# Altium project InterVehicle Communication.PrjPcb
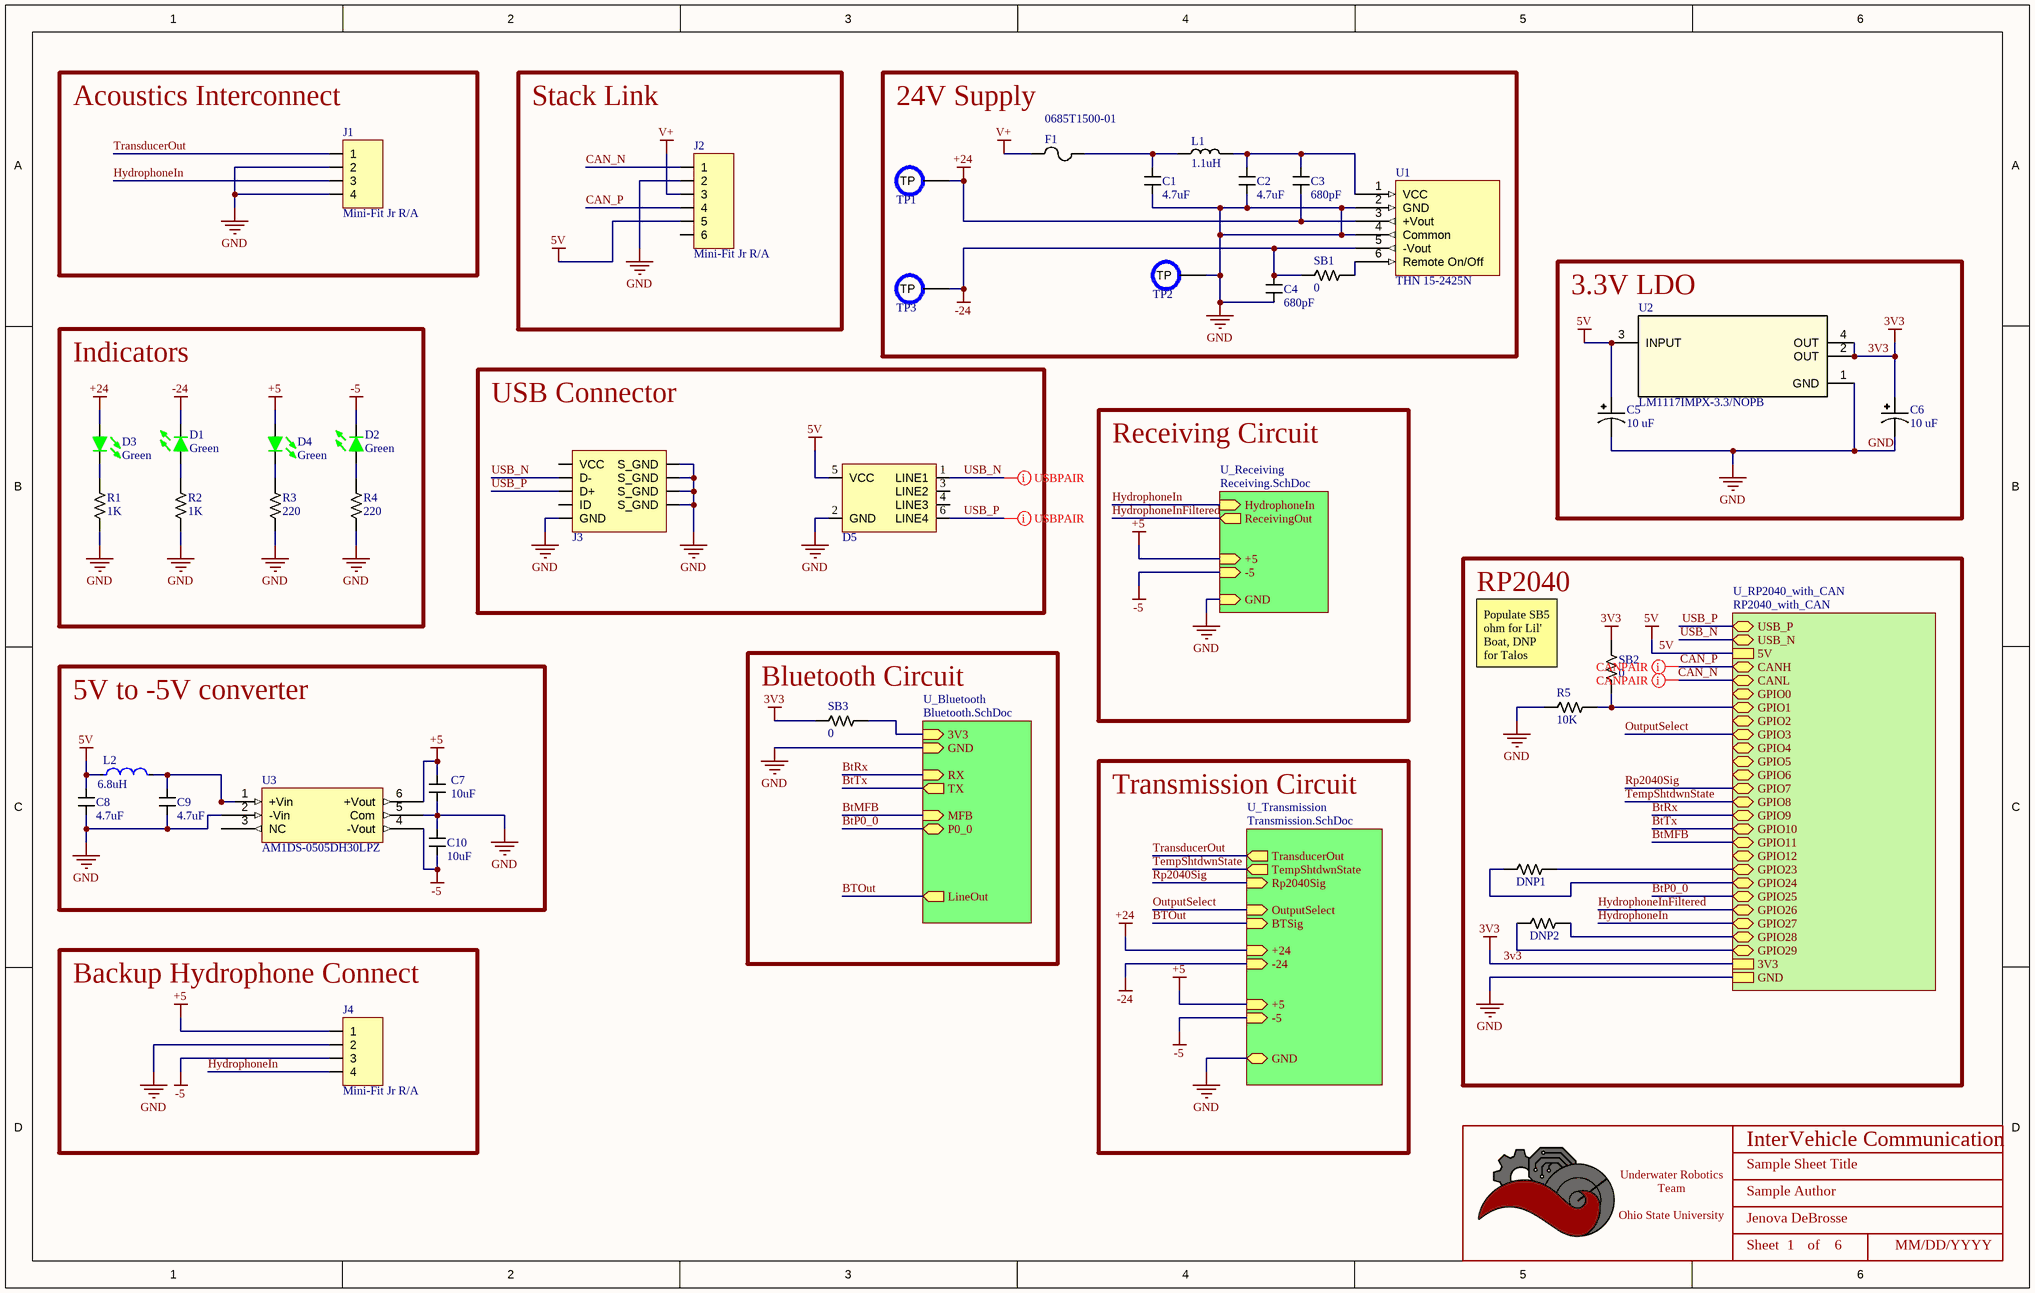
[diagram p0: Power and Connections.SchDoc]
BoardRevision: 1.0; DateOfDesignReview: XX/XX/XXXX; ProjectTitle: InterVehicle Communication; TeamLead: Jenova DeBrosse
4 sheets, 59 parts. Net scope: hierarchical (ports join the sheet entries above them; power ports are global).
Board files: Pcb_4layer_4x4_Template.PcbDoc, Pcb_2layer_4x4_Template.PcbDoc, Pcb_2layer_8x4_Template_NoCenterHoles.PcbDoc, Pcb_4layer_8x4_Template_NoCenterHoles.PcbDoc, Pcb_2layer_8x4_Template.PcbDoc, Pcb_4layer_8x4_Template.PcbDoc
Sheets:
  Power and Connections.SchDoc
    U_Receiving = Receiving.SchDoc
    U_Bluetooth = Bluetooth.SchDoc
    U_Transmission = Transmission.SchDoc

## Sheet Power and Connections.SchDoc: Sample Sheet Title
size B; Date: MM/DD/YYYY; Author: Sample Author; Organization: ORGANIZATION; Address1: ADDRESS 1; Address2: ADDRESS 2; Address3: ADDRESS 3; Address4: ADDRESS 4; Revision: -; SheetNumber: 1; SheetTotal: 6; ENG_APP_DATE: --/--/--; DSN_APP_DATE: --/--/--; CHK_APP_DATE: --/--/--

### Parts
(Parts that share a designator on the sheet are numbered #1, #2 ... from top to bottom, then left to right.)
*#1  Title_Block  [LOGO]  (value not drawn)  (graphical)
C1  value 4.7uF  [CAPACITOR_1206]  (hidden comment: AGC1206X7R500-475KXE*)
C2  value 4.7uF  [CAPACITOR_1206]  (hidden comment: AGC1206X7R500-475KXE*)
C3  value 680pF  [CAPACITOR_1808]  (hidden comment: CC1808KKX7REBB681)
C4  value 680pF  [CAPACITOR_1808]  (hidden comment: CC1808KKX7REBB681)
C5  Value (uF): 10 uF  [CAPACITOR_1206 - POLAR]  (hidden comment: 10uF Tantalum 16V)
C6  Value (uF): 10 uF  [CAPACITOR_1206 - POLAR]  (hidden comment: 10uF Tantalum 16V)
C7  value 10uF  [CAPACITOR_0603]  (hidden comment: CL10X106MO8NRNC)
C8  value 4.7uF  [CAPACITOR_0603]  (hidden comment: 4.7uF Ceramic 6.3V)
C9  value 4.7uF  [CAPACITOR_0603]  (hidden comment: 4.7uF Ceramic 6.3V)
C10  value 10uF  [CAPACITOR_0603]  (hidden comment: CL10X106MO8NRNC)
D1  Color: Green  [LED_0603]  (hidden comment: 150060GS75000)
D2  Color: Green  [LED_0603]  (hidden comment: 150060GS75000)
D3  Color: Green  [LED_0603]  (hidden comment: 150060GS75000)
D4  Color: Green  [LED_0603]  (hidden comment: 150060GS75000)
D5  TVS DIODE 5VWM 25VC SOT23-6  [SOT 23-6L]  (value not drawn)
DNP1  DNP  [RESISTOR_0402]  (value not drawn)
DNP2  DNP  [RESISTOR_0402]  (value not drawn)
F1  0685T1500-01  [CAPACITOR_1206]
J1  Mini-Fit Jr R/A  [CONN_MOLEX_MINIFIT JR_4 POS_R/A]
J2  Mini-Fit Jr R/A  [CONN_MOLEX_MINIFIT JR_6 POS_R/A]
J3  USB_MICRO R/A  [CONN_MINIUSB]  (value not drawn)
J4  Mini-Fit Jr R/A  [CONN_MOLEX_MINIFIT JR_4 POS_R/A]
L1  value 1.1uH  [INDUCTOR_TCK078]  (hidden comment: TCK-078)
L2  value 6.8uH  [INDUCTOR_0805]  (hidden comment: MLZ2012N6R8LT000)
R1  Value  (Ohms): 1K  [RESISTOR_0603]  (hidden comment: 1k Ohm 5% 1/8W)
R2  Value  (Ohms): 1K  [RESISTOR_0603]  (hidden comment: 1k Ohm 5% 1/8W)
R3  Value  (Ohms): 220  [RESISTOR_0603]  (hidden comment: 220 Ohm 5% 1/8W)
R4  Value  (Ohms): 220  [RESISTOR_0603]  (hidden comment: 220 Ohm 5% 1/8W)
R5  Value  (Ohms): 10K  [RESISTOR_0603]  (hidden comment: 10k Ohm 5% 1/10W)
SB1  value 0  [RESISTOR_1206]  (hidden comment: JUMPER_0_1206)
SB2  Value  (Ohms): 0  [RESISTOR_0603]  (hidden comment: 0 Ohm Jumper No Fit)
SB3  Value  (Ohms): 0  [RESISTOR_0603]  (hidden comment: 0 Ohm Jumper No Fit)
TP1  PCB Test Point  [TESTPOINT_1.2MM]  (value not drawn)  (no BOM)
TP2  PCB Test Point  [TESTPOINT_1.2MM]  (value not drawn)  (no BOM)
TP3  PCB Test Point  [TESTPOINT_1.2MM]  (value not drawn)  (no BOM)
U1  THN 15-2425N  [THN_15-2425N]
U2  LM1117IMPX-3.3/NOPB  [SOT-223-4]
U3  AM1DS-0505DH30LPZ  [AM1DS-0505DH30LPZ]

### Blocks framed on the sheet
Acoustics Interconnect: J1
Stack Link: J2
24V Supply: C1-C4 F1 L1 SB1 TP1-TP3 U1
3.3V LDO: C5 C6 U2
Indicators: D1-D4 R1-R4
USB Connector: D5 J3
RP2040: DNP1 DNP2 R5 SB2
5V to -5V converter: C7-C10 L2 U3
Bluetooth Circuit: SB3
Backup Hydrophone Connect: J4

### Sub-sheets
U_Bluetooth = Bluetooth.SchDoc: 3V3 (in), GND (in), MFB (in), RX (in), TX (out), P0_0 (bidir), LineOut (out)
U_Receiving = Receiving.SchDoc: +5 (in), GND (in), HydrophoneIn (in), ReceivingOut (out), -5 (in)
U_RP2040_with_CAN = RP2040_with_CAN (file not in this document): USB_P (bidir), USB_N (bidir), 5V, CANH (bidir), CANL (bidir), GPIO0 (bidir), GPIO1 (bidir), GPIO2 (bidir), GPIO3 (bidir), GPIO4 (bidir), GPIO5 (bidir), GPIO6 (bidir), GPIO7 (bidir), GPIO8 (bidir), GPIO9 (bidir), GPIO10 (bidir), GPIO11 (bidir), GPIO12 (bidir), GPIO23 (bidir), GPIO24 (bidir), GPIO25 (bidir), GPIO26 (bidir), GPIO27 (bidir), GPIO28 (bidir), GPIO29 (bidir), 3V3, GND
U_Transmission = Transmission.SchDoc: TransducerOut (out), TempShtdwnState (out), +24 (in), -24 (in), +5 (in), -5 (in), GND (bidir), Rp2040Sig (in), OutputSelect (in), BTSig (in)

### Nets
3V3: C6.1 SB2.1 SB3.2 U2.2(OUT) U2.4(OUT) ; sheet U_RP2040_with_CAN/3V3
5V: C5.1 C8.1 D5.5(VCC) J2.5 L2.1 U2.3(INPUT) ; sheet U_RP2040_with_CAN/5V
+5: C7.1 D4.1 J4.1 U3.6(+Vout) ; sheet U_Receiving/+5, sheet U_Transmission/+5
+24: C3.2 D3.1 TP1.TP U1.3(+Vout) ; sheet U_Transmission/+24
-5: C10.2 D2.2 J4.3 U3.4(-Vout) ; sheet U_Receiving/-5, sheet U_Transmission/-5
-24: C4.1 D1.2 SB1.2 TP3.TP U1.5(-Vout) ; sheet U_Transmission/-24
GND: C1.2 C2.2 C4.2 C5.2 C6.2 C7.2 C8.2 C9.2 C10.1 D5.2(GND) J1.2 J1.4 J2.2 J3.5(GND) J3.6(S_GND) J3.7(S_GND) J3.8(S_GND) J3.9(S_GND) J4.2 R1.2 R2.2 R3.2 R4.2 R5.2 TP2.TP U1.2(GND) U1.4(Common) U2.1(GND) U3.2(-Vin) U3.5(Com) ; sheet U_RP2040_with_CAN/GND, sheet U_Receiving/GND, sheet U_Bluetooth/GND, sheet U_Transmission/GND
V+: F1.1 J2.3
BtMFB: sheet U_RP2040_with_CAN/GPIO11, sheet U_Bluetooth/MFB
BTOut: sheet U_Bluetooth/LineOut, sheet U_Transmission/BTSig
BtP0_0: sheet U_RP2040_with_CAN/GPIO25, sheet U_Bluetooth/P0_0
BtRx: sheet U_RP2040_with_CAN/GPIO9, sheet U_Bluetooth/RX
BtTx: sheet U_RP2040_with_CAN/GPIO10, sheet U_Bluetooth/TX
CAN_N: J2.1 ; sheet U_RP2040_with_CAN/CANL
CAN_P: J2.4 ; sheet U_RP2040_with_CAN/CANH
HydrophoneIn: J1.3 J4.4 ; sheet U_RP2040_with_CAN/GPIO27, sheet U_Receiving/HydrophoneIn
HydrophoneInFiltered: sheet U_RP2040_with_CAN/GPIO26, sheet U_Receiving/ReceivingOut
OutputSelect: sheet U_RP2040_with_CAN/GPIO3, sheet U_Transmission/OutputSelect
Rp2040Sig: sheet U_RP2040_with_CAN/GPIO7, sheet U_Transmission/Rp2040Sig
TempShtdwnState: sheet U_RP2040_with_CAN/GPIO8, sheet U_Transmission/TempShtdwnState
TransducerOut: J1.1 ; sheet U_Transmission/TransducerOut
USB_N: D5.1(LINE1) J3.2(D-) ; sheet U_RP2040_with_CAN/USB_N
USB_P: D5.6(LINE4) J3.3(D+) ; sheet U_RP2040_with_CAN/USB_P
NetC1_1: C1.1 F1.2 L1.1
NetC2_1: C2.1 C3.1 L1.2 U1.1(VCC)
NetC9_1: C9.1 L2.2 U3.1(+Vin)
NetD1_1: D1.1 R2.1
NetD2_1: D2.1 R4.1
NetD3_2: D3.2 R1.1
NetD4_2: D4.2 R3.1
NetDNP1_1: DNP1.1 ; sheet U_RP2040_with_CAN/GPIO23
NetDNP1_2: DNP1.2 ; sheet U_RP2040_with_CAN/GPIO24
NetDNP2_1: DNP2.1 ; sheet U_RP2040_with_CAN/GPIO28
NetDNP2_2: DNP2.2 ; sheet U_RP2040_with_CAN/GPIO29
NetR5_1: R5.1 SB2.2 ; sheet U_RP2040_with_CAN/GPIO1
NetSB1_1: SB1.1 U1.6(Remote_On/Off)
NetSB3_1: SB3.1 ; sheet U_Bluetooth/3V3

Not connected (* = marked no-connect by the designer): D5 3(LINE2) 4(LINE3); J2 6; J3 1(VCC) 4(ID); U3 3(NC)

### Layout directives
differential pair: CAN_N, CAN_P, USB_N, USB_P

### Notes on the sheet
- Receiving Circuit
- Populate SB5 ohm for Lil' Boat, DNP for Talos
- Transmission Circuit
- DWG. NO.
- REV.
- SHT.
- THIS DOCUMENT AND THE DATA DISCLOSED HEREIN OR HEREWITH IS THE PROPERTY OF ALTIUM LIMITED AND MAY BE FREELY DISTRIBUTED IN WHOLE. NO RIGHTS ARE RESERVED OR EXPRESS OR IMPLIED WARANTEE GIVEN.
- REVISION
- DESCRIPTION
- DATE
- APPROVED
- ENG:
- APPROVALS
- PROJECT
- DSN:
- CHK:
- REFERENCE DOCUMENTS
- PROJECT REVISION:
- TITLE
- DOCUMENT REVISION:
- DESIGN ITEM:
- BOM:
- FAB DWG:
- PCB DWG:
- ASSY DWG:
- SCALE:
- SIZE
- B
- CAGE CODE
- FILE NAME
- DWG NO.
- SHEET
- OF
- REV
- (in symbol Title_Block) Underwater Robotics Team / Ohio State University; Sheet; of

### Library data of the parts
*#1 = Title_Block: UWRT Schematic Title Block Template / Created June 2021, Dylan Trainor
C1 C2 = 4.7u Auto Grade Capacitor,1206,X7R,50: 4.7 µF ±10% 50V Ceramic Capacitor X7R 1206 (3216 Metric)
C3 C4 = CAP CER 680PF 3KV X7R 1808
C5 C6 = CAPACITOR_10uF_1206_Tantalum_1: Cap 10uF 16V +/-20% / Tantalum 1206; Tolerance: +/- 10%; Made By: Dylan T; ComponentLink1Description: Digikey; ComponentLink1URL: https://www.digikey.com/en/products/detail/kyocera-avx/F981A106MMA/4004990; Voltage: 16V; Supplier 1: Newark; Supplier Part Number 1: 26AC4143
C7 C10 = CAP CER 10UF 16V X6S 0603: 10 µF ±20% 16V Ceramic Capacitor X6S 0603 (1608 Metric)
C8 C9 = CAPACITOR_4.7uF_0603: Cap 4.7uF 6.3V +/-10% / Ceramic 0603; Made By: Robert Pafford; Tolerance: +/- 10%; Voltage: 6.3V; Supplier 1: Digi-Key; Supplier Part Number 1: 1276-2087-1-ND
D1-D4 = LED_Green_0603_3.2V: LED Green Vf= 3.2V If = 0.025A / 150060GS75000; Made By: Flip B; Forward Current: 25mA; Supplier 1: Digi-Key; ComponentLink1Description: Datasheet; ComponentLink1URL: https://www.we-online.de/katalog/datasheet/150060GS75000.pdf; Supplier Part Number 1: 732-4971-1-ND; Forward Voltage: 3.2V; Package: 0603
D5 = RCLAMP0504S.TCT: 25V Clamp 6A (8/20µs) Ipp Tvs Diode Surface Mount SOT-23-6; Made By: Robert Pafford; Reverse Standoff Voltage (Typ): 5V; Breakdown Voltage (Min): 6V; Supplier 1: Digi-Key; Supplier Part Number 1: RCLAMP0504SCT-ND; Clamping Voltage (Max): 25V
DNP1 DNP2 = DNP_0402: Do Not Populate 0402
F1 = 0685T1500-01: FUSE BRD MNT 1.5A 63VAC/VDC 1206
J1 J4 = CONN_MOLEX_MINIFIT JR_4POS_R/A: Molex Minifit Jr. 5569 / 4 Pos R/A Natural; Pitch: 4.2mm; Configuration: Right Angle; Current Per Pin: 13A; Number of Positions: 4; Supplier Part Number 1: WM13112-ND; Supplier 1: Digi-Key; Manufacturer: Molex; Color: Natural; Created By: Flip B; ComponentLink1Description: Datasheet; ComponentLink1URL: https://www.molex.com/pdm_docs/sd/026013115_sd.pdf; Series: Minifit Jr 5569
J2 = CONN_MOLEX_MINIFIT JR_6POS_R/A: Molex Minifit Jr. 5569 / 6 Pos R/A Natural; Pitch: 4.2mm; Configuration: Right Angle; Current Per Pin: 13A; Number of Positions: 8; Manufacturer: Molex; Color: Natural; Created By: Flip B; ComponentLink1Description: Datasheet; ComponentLink1URL: https://www.molex.com/pdm_docs/ps/PS-5556-001.pdf; Series: Minifit Jr 5569; Supplier 1: Digi-Key; Supplier Part Number 1: WM1353-ND
J3 = CONN_MICROUSB: Amphenol Micro USB-B / USB2.0 5 Pin Right Angle SMD; Pitch: 0.65mm; Current Per Pin: 1.8A; Number of Positions: 5; Manufacturer: Amphenol; Configuration: Right Angle; Color: Silver; Created By: Flip B; ComponentLink1Description: Datasheet; ComponentLink1URL: https://cdn.amphenol-icc.com/media/wysiwyg/files/documentation/datasheet/inputoutput/io_usb_micro.pdf?__cf_chl_jschl_tk__=05693735e19256298f6ef6ca2bb2e65c376a4f56-1625503833-0-Abitsb0-ufjOXJYs_S3J3r2iTn-nObalbmXUksF1VvO_h_WEmRdMlUD1I8-hmWSEVWzY1pirKnrPZWfgY3851qyBZe5ZvnNQePLGIzUgdEIQBVUyW36RsbYpDLEWxJ4horD-5gChFgobLYqwmG5aHl0E8lIn_twwPPrOxilK2gP0q9t_CNOs_u5fMqXvXUrlsOv8tIE2NRlu6NVP8qtkL2GjhlkeTUbDMF8WvvpPDTFOgvZ4Y16Ej8F8AhWos88mo5B1HssXozw0XrkJQIqERITUu6rqloz9kf4ZzhBHtDAt-IkiAFY_Ds9SW8FYKKTtINJVpHZQ6Gyu1FFM4Dc9MO0maE8_mmNcwlxqyRoRk_MPWW8VyByXWM5RSp52jteRKw7FeI9WIYvCbPAOy0Eyib-aseIQsnGbglBcUY6_2xp8GYaJM38H3dNvBPsSOfJBPndKedwKHllxjkucXn6xsN0sDXkpGN-cu8_2bDTJ0g-uUucKSCooYX-ApSDNGpkA_p9zv1SOAD8c0zaZVmtiBsN75QpVz2rzq9_BFxOywPvR; Series: 10118192; Supplier 1: Digi-Key; Supplier Part Number 1: 609-4613-1-ND
L1 = FIXED IND 1.1UH 3.24A 15 MOHM: 1.1 µH Unshielded Inductor 3.24 A 15mOhm Max Nonstandard
L2 = INDUCTOR_6.8uH_Shielded Multilayer ±20% 550mA 325mΩ SMD 0805: Shielded Multilayer Inductor 6.8uH ±20% 550mA 325mΩ SMD 0805; Test Frequency: 2MHz; Self Resonant Frequency: 60MHz; Saturation Current: 110mA; Core Material: Ferrite; DC Resistance (DCR): 250mR; Current Rating: 550mA; Case/Package: 0805; Height - Seated (Max): 0.057inch; Lead Free: Lead Free; Mount: Surface Mount; Max Operating Temperature: 125°C; Length: 0.079inch; Min Operating Temperature: -55°C; RoHS Compliant: Yes; Case Code (Imperial): 0805; Shielding: Shielded; Tolerance: 20%; Width: 0.049inch; Inductance: 6.8uH; Packaging: Tape and Reel; Package Quantity: 1; Case Code (Metric): 2012
R1 R2 = RESISTOR_1K_0603: RES 1k OHM 5% 1/8W 0603; Tolerance: +/- 5%; Made By: Robert Pafford; ComponentLink1Description: Datasheet; ComponentLink1URL: https://www.bourns.com/docs/product-datasheets/CRxxxxx.pdf; Wattage: 1/8W; Supplier: Digikey; Digikey Part Numer: CR0603-JW-104ELFTR-ND; Supplier 1: Digi-Key; Supplier Part Number 1: 2019-RK73B1JTTD102JCT-ND
R3 R4 = RESISTOR_200_0603: RES 220 OHM 5% 1/8W 0603; Tolerance: +/- 5%; Made By: John S; ComponentLink1Description: Digikey; ComponentLink1URL: https://www.digikey.com/en/products/detail/koa-speer-electronics-inc/RK73B1JTTD101J/9844701; Wattage: 1/8W; Supplier 1: Digi-Key; Supplier Part Number 1: 2019-RK73B1JTTD221JCT-ND
R5 = RESISTOR_10K_0603: RES 10k OHM 5% 1/10W 0603; Tolerance: +/- 5%; Wattage: 1/8W; Made By: Robert Pafford; ComponentLink1Description: Datasheet; ComponentLink1URL: https://www.bourns.com/docs/product-datasheets/CRxxxxx.pdf; Supplier: Digikey; Digikey Part Numer: CR0603-JW-104ELFTR-ND; Supplier 1: Digi-Key; Supplier Part Number 1: 2019-RK73B1JTTD103JCT-ND
SB1 = JUMPER_0_1206: JUMPER 0OHM
SB2 SB3 = JUMPER_0_0603: 0 Ohm Jumper No Fit for Solder Bridge; Made By: Robert Pafford; ComponentLink1Description: Digikey; ComponentLink1URL: https://www.digikey.com/en/products/detail/koa-speer-electronics-inc/RK73B1JTTD101J/9844701
TP1-TP3 = TESTPOINT: Made By: Robert Pafford
U1 = THN 15-2425N: DC DC CONVERTER +/-24V 15W
U2 = LM1117IMPX-3.3/NOPB: IC REG LIN 3.3V 800MA SOT223-4; PartNumber: LM1117IMP-3.3/NOPB; Manufacturer: Texas Instruments; Vin (Max): 15V; Supplier 1: Digi-Key; Supplier Part Number 1: LM1117IMPX-3.3/NOPBCT-ND; Vout (Min/Fixed): 3.3V; Amp Out: 800mA; Package: SOT-223-4; Created By: Dylan T
U3 = AM1DS-0505DH30LPZ: Isolated Module DC DC Converter 2 Output -5V 5V 100mA, 100mA 4.5V - 5.5V Input

## Sheet Receiving.SchDoc: Sample Sheet Title
size B; Date: MM/DD/YYYY; Author: Sample Author; Organization: ORGANIZATION; Address1: ADDRESS 1; Address2: ADDRESS 2; Address3: ADDRESS 3; Address4: ADDRESS 4; Revision: -; SheetNumber: 3; SheetTotal: 6; ENG_APP_DATE: --/--/--; DSN_APP_DATE: --/--/--; CHK_APP_DATE: --/--/--
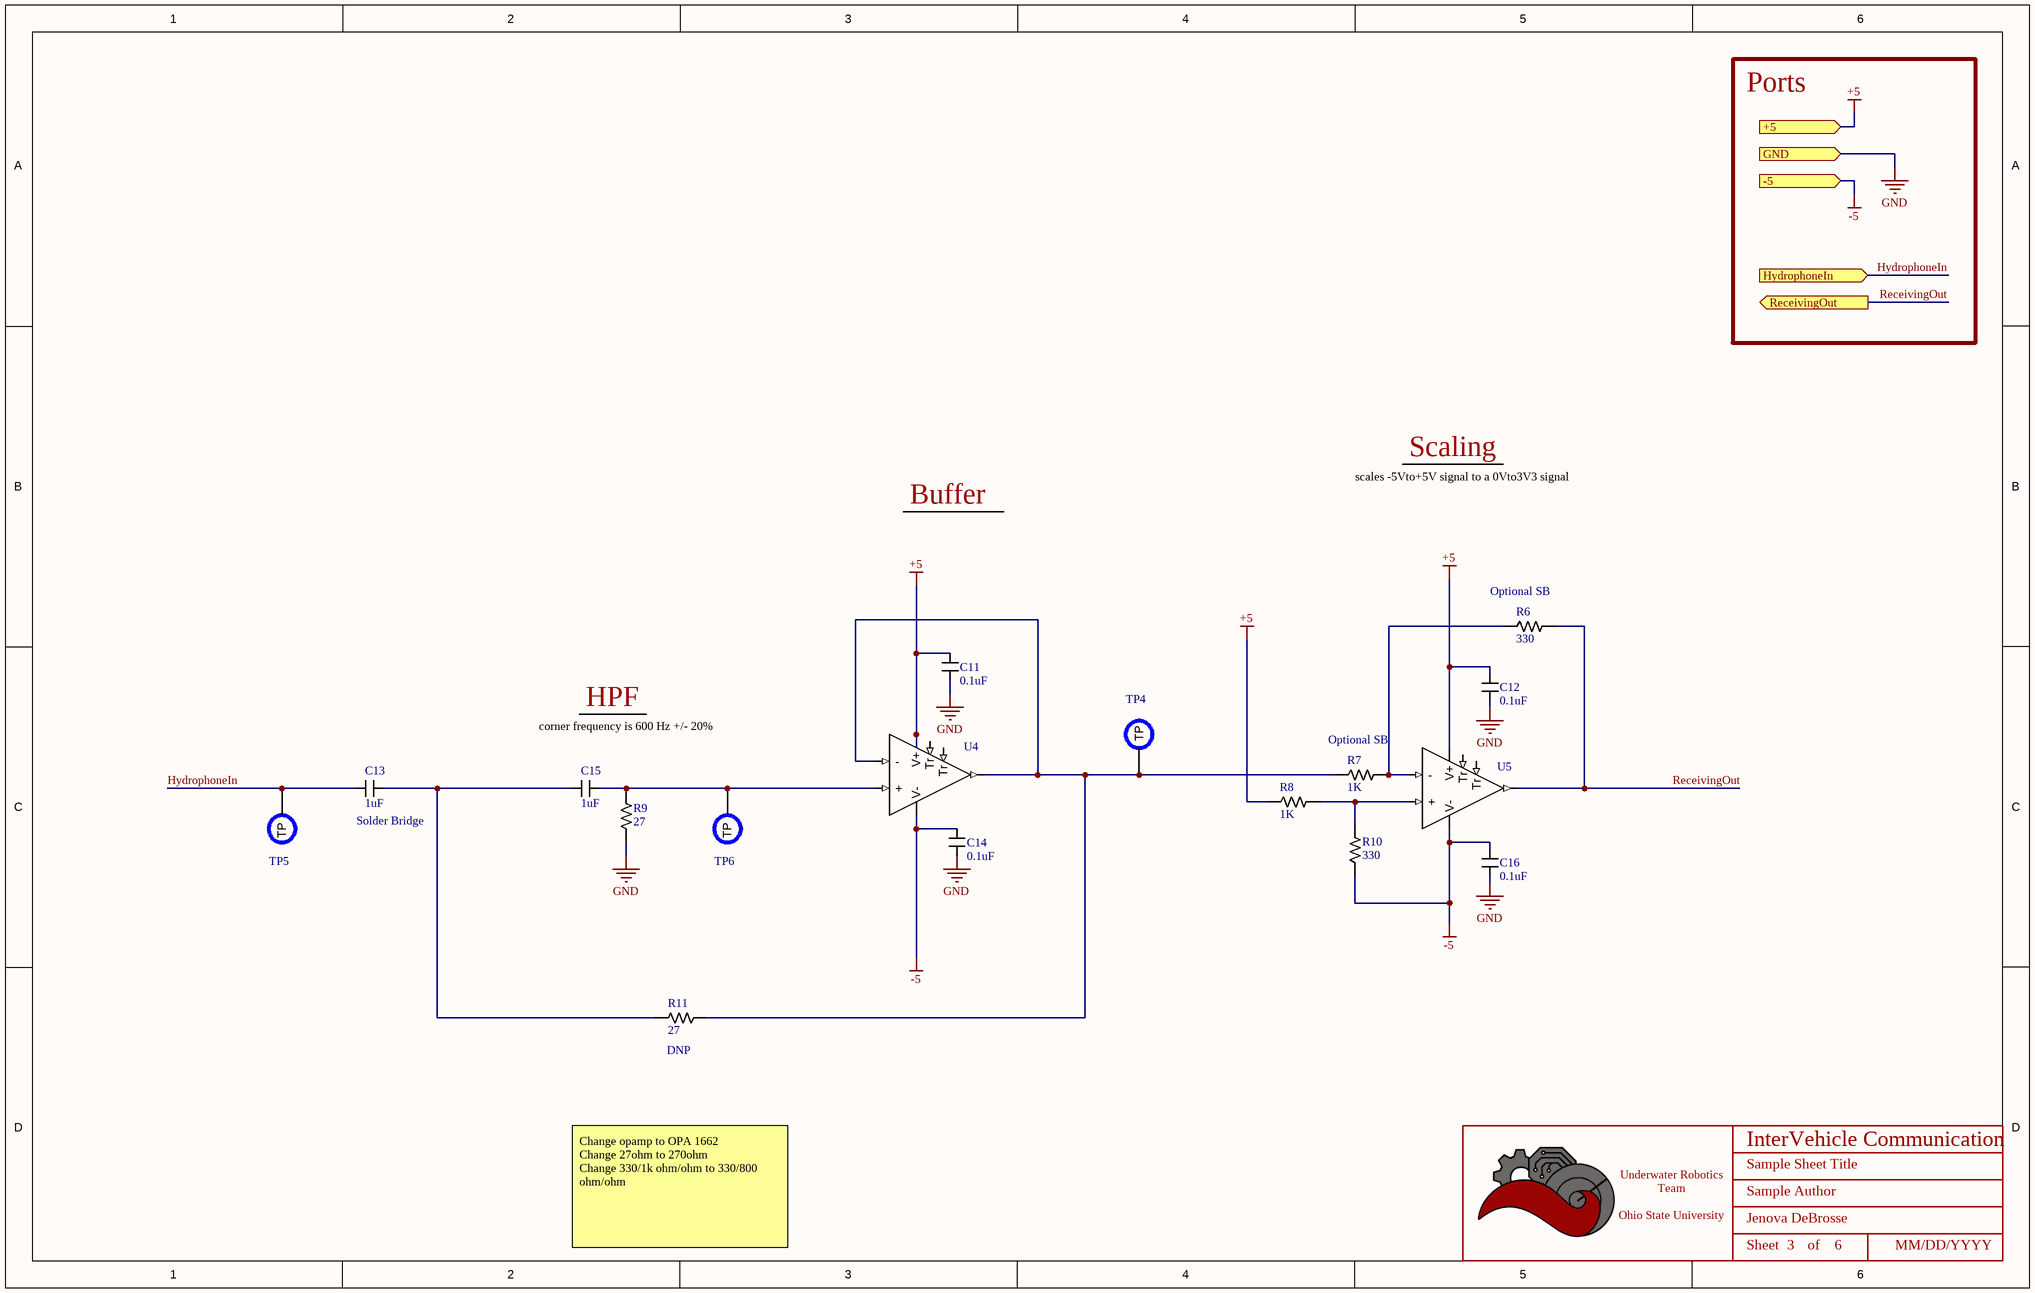
[diagram p1: Receiving.SchDoc]

### Parts
(Parts that share a designator on the sheet are numbered #1, #2 ... from top to bottom, then left to right.)
*#2  Title_Block  [LOGO]  (value not drawn)  (graphical)
C11  value 0.1uF  [CAPACITOR_0603]  (hidden comment: 100nF Ceramic 6.3V)
C12  value 0.1uF  [CAPACITOR_0603]  (hidden comment: 100nF Ceramic 6.3V)
C13  value 1uF  [CAPACITOR_0603]  (hidden comment: 1uF Ceramic 16V)
C14  value 0.1uF  [CAPACITOR_0603]  (hidden comment: 100nF Ceramic 6.3V)
C15  value 1uF  [CAPACITOR_0603]  (hidden comment: 1uF Ceramic 16V)
C16  value 0.1uF  [CAPACITOR_0603]  (hidden comment: 100nF Ceramic 6.3V)
R6  Value  (Ohms): 330  [RESISTOR_0603]  (hidden comment: 330 Ohm 1% 1/10W)
R7  Value  (Ohms): 1K  [RESISTOR_0603]  (hidden comment: 1k Ohm 5% 1/10W)
R8  Value  (Ohms): 1K  [RESISTOR_0603]  (hidden comment: 1k Ohm 5% 1/10W)
R9  Value  (Ohms): 27  [RESISTOR_0402]  (hidden comment: 27 Ohm 1% 1/16W)
R10  Value  (Ohms): 330  [RESISTOR_0603]  (hidden comment: 330 Ohm 1% 1/10W)
R11  Value  (Ohms): 27  [RESISTOR_0402]  (hidden comment: 27 Ohm 1% 1/16W)
TP4  PCB Test Point  [TESTPOINT_1.2MM]  (value not drawn)  (no BOM)
TP5  PCB Test Point  [TESTPOINT_1.2MM]  (value not drawn)  (no BOM)
TP6  PCB Test Point  [TESTPOINT_1.2MM]  (value not drawn)  (no BOM)
U4  IC OPAMP GP 1 CIRCUIT 8SOIC  [SOIC-8]  (value not drawn)
U5  IC OPAMP GP 1 CIRCUIT 8SOIC  [SOIC-8]  (value not drawn)

### Ports
+5 (in), -5 (in), GND (in), HydrophoneIn (in), ReceivingOut (out)

### Nets
+5: C11.1 C12.1 R8.2 U4.7(V+) U5.7(V+) ; port +5
-5: C14.1 C16.1 R10.2 U4.4(V-) U5.4(V-) ; port -5
GND: C11.2 C12.2 C14.2 C16.2 R9.2 ; port GND
HydrophoneIn: C13.2 TP5.TP ; port HydrophoneIn
ReceivingOut: R6.1 U5.6(Output) ; port ReceivingOut  [project net HydrophoneInFiltered]
NetC13_1: C13.1 C15.2 R11.1
NetC15_1: C15.1 R9.1 TP6.TP U4.3(+)
NetR6_2: R6.2 R7.1 U5.2(-)
NetR7_2: R7.2 R11.2 TP4.TP U4.2(-) U4.6(Output)
NetR8_1: R8.1 R10.1 U5.3(+)

Not connected (* = marked no-connect by the designer): U4 1(Tr) 8(Tr); U5 1(Tr) 8(Tr)

### Notes on the sheet
- Ports
- Buffer
- scales -5Vto+5V signal to a 0Vto3V3 signal
- Scaling
- (near R6) Optional SB
- corner frequency is 600 Hz +/- 20%
- HPF
- Optional SB
- (near C13) Solder Bridge
- (near R11) DNP
- Change opamp to OPA 1662
  Change 27ohm to 270ohm
  Change 330/1k ohm/ohm to 330/800 ohm/ohm
- DWG. NO.
- REV.
- SHT.
- THIS DOCUMENT AND THE DATA DISCLOSED HEREIN OR HEREWITH IS THE PROPERTY OF ALTIUM LIMITED AND MAY BE FREELY DISTRIBUTED IN WHOLE. NO RIGHTS ARE RESERVED OR EXPRESS OR IMPLIED WARANTEE GIVEN.
- REVISION
- DESCRIPTION
- DATE
- APPROVED
- ENG:
- APPROVALS
- PROJECT
- DSN:
- CHK:
- REFERENCE DOCUMENTS
- PROJECT REVISION:
- TITLE
- DOCUMENT REVISION:
- DESIGN ITEM:
- BOM:
- FAB DWG:
- PCB DWG:
- ASSY DWG:
- SCALE:
- SIZE
- B
- CAGE CODE
- FILE NAME
- DWG NO.
- SHEET
- OF
- REV
- (in symbol Title_Block) Underwater Robotics Team / Ohio State University; Sheet; of

### Library data of the parts
*#2 = Title_Block: as *#1 on sheet Power and Connections
C11 C12 C14 C16 = CAPACITOR_0.1uF_0603: Cap 100nF 6.3V +/-10% / Ceramic 0603; Made By: Flip B; ComponentLink1Description: Datsheet; ComponentLink1URL: https://www.mouser.com/datasheet/2/212/KEM_C1002_X7R_SMD-1102033.pdf; Tolerance: +/- 10%; Voltage: 6.3V; Supplier 1: Digi-Key; Supplier Part Number 1: 399-15351-1-ND
C13 C15 = CAPACITOR_1uF_0603: Cap 1uF 16V +/-10% / Ceramic 0603; Made By: Flip B; Tolerance: +/- 10%; Voltage: 16V; Supplier 1: Arrow Electronics; Supplier Part Number 1: C1608X7R1C105K080AC
R6 R10 = RESISTOR_330_0603: RES 330 OHM 1% 1/10W 0603; Tolerance: +/- 1%; Made By: Robert Pafford; Wattage: 1/10W; Supplier 1: Digi-Key; Supplier Part Number 1: P330HCT-ND
R7 R8 = RESISTOR_1K_0.5%_0603: RES 1k OHM 0.5% 1/10W 0603; Tolerance: +/- 0.5%; Made By: Robert Pafford; Wattage: 1/10W; Supplier: Digikey; Digikey Part Numer: CR0603-JW-104ELFTR-ND; Supplier 1: Digi-Key; Supplier Part Number 1: 749-1693-1-ND
R9 R11 = RESISTOR_27_0402: RES 27 OHM 1% 1/16W 0402; Tolerance: +/- 1%; Made By: Robert Pafford; Wattage: 1/16W; Supplier: Digikey; Digikey Part Numer: CR0603-JW-104ELFTR-ND; Supplier 1: Digi-Key; Supplier Part Number 1: YAG5278DKR-ND
TP4-TP6 = TESTPOINT: Made By: Robert Pafford
U4 U5 = OPA228U: General Purpose Amplifier 1 Circuit 8-SOIC

## Sheet Bluetooth.SchDoc: Sample Sheet Title
size B; Date: MM/DD/YYYY; Author: Sample Author; Organization: ORGANIZATION; Address1: ADDRESS 1; Address2: ADDRESS 2; Address3: ADDRESS 3; Address4: ADDRESS 4; Revision: -; SheetNumber: 4; SheetTotal: 4; ENG_APP_DATE: --/--/--; DSN_APP_DATE: --/--/--; CHK_APP_DATE: --/--/--
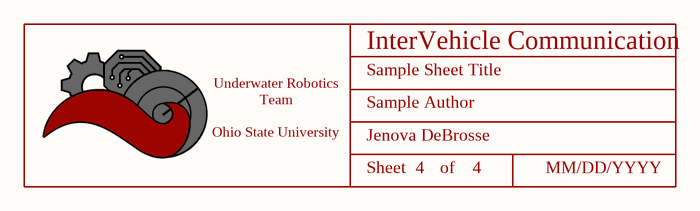
[diagram p2: Bluetooth.SchDoc]

### Parts
(Parts that share a designator on the sheet are numbered #1, #2 ... from top to bottom, then left to right.)
*#3  Title_Block  [LOGO]  (value not drawn)  (graphical)

### Notes on the sheet
- DWG. NO.
- REV.
- SHT.
- THIS DOCUMENT AND THE DATA DISCLOSED HEREIN OR HEREWITH IS THE PROPERTY OF ALTIUM LIMITED AND MAY BE FREELY DISTRIBUTED IN WHOLE. NO RIGHTS ARE RESERVED OR EXPRESS OR IMPLIED WARANTEE GIVEN.
- REVISION
- DESCRIPTION
- DATE
- APPROVED
- ENG:
- APPROVALS
- PROJECT
- DSN:
- CHK:
- REFERENCE DOCUMENTS
- PROJECT REVISION:
- TITLE
- DOCUMENT REVISION:
- DESIGN ITEM:
- BOM:
- FAB DWG:
- PCB DWG:
- ASSY DWG:
- SCALE:
- SIZE
- B
- CAGE CODE
- FILE NAME
- DWG NO.
- SHEET
- OF
- REV
- (in symbol Title_Block) Underwater Robotics Team / Ohio State University; Sheet; of

### Library data of the parts
*#3 = Title_Block: as *#1 on sheet Power and Connections

## Sheet Transmission.SchDoc: Sample Sheet Title
size B; Date: MM/DD/YYYY; Author: Sample Author; Organization: ORGANIZATION; Address1: ADDRESS 1; Address2: ADDRESS 2; Address3: ADDRESS 3; Address4: ADDRESS 4; Revision: -; SheetNumber: 2; SheetTotal: 2; ENG_APP_DATE: --/--/--; DSN_APP_DATE: --/--/--; CHK_APP_DATE: --/--/--
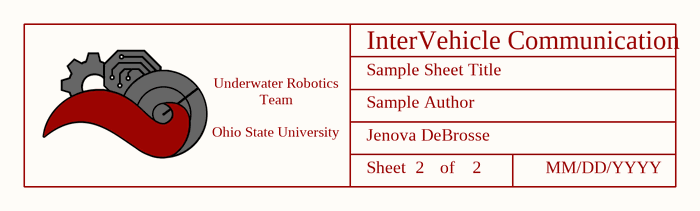
[diagram p3: Transmission.SchDoc]

### Parts
(Parts that share a designator on the sheet are numbered #1, #2 ... from top to bottom, then left to right.)
*#4  Title_Block  [LOGO]  (value not drawn)  (graphical)

### Notes on the sheet
- DWG. NO.
- REV.
- SHT.
- THIS DOCUMENT AND THE DATA DISCLOSED HEREIN OR HEREWITH IS THE PROPERTY OF ALTIUM LIMITED AND MAY BE FREELY DISTRIBUTED IN WHOLE. NO RIGHTS ARE RESERVED OR EXPRESS OR IMPLIED WARANTEE GIVEN.
- REVISION
- DESCRIPTION
- DATE
- APPROVED
- ENG:
- APPROVALS
- PROJECT
- DSN:
- CHK:
- REFERENCE DOCUMENTS
- PROJECT REVISION:
- TITLE
- DOCUMENT REVISION:
- DESIGN ITEM:
- BOM:
- FAB DWG:
- PCB DWG:
- ASSY DWG:
- SCALE:
- SIZE
- B
- CAGE CODE
- FILE NAME
- DWG NO.
- SHEET
- OF
- REV
- (in symbol Title_Block) Underwater Robotics Team / Ohio State University; Sheet; of

### Library data of the parts
*#4 = Title_Block: as *#1 on sheet Power and Connections

## Nets that join several sheets
+5: Power and Connections (C7.1 D4.1 J4.1 U3.6), Receiving (5 pins)
-5: Power and Connections (C10.2 D2.2 J4.3 U3.4), Receiving (5 pins)
GND: Power and Connections (30 pins), Receiving (5 pins)
HydrophoneIn: Power and Connections (J1.3 J4.4), Receiving (C13.2 TP5.TP)